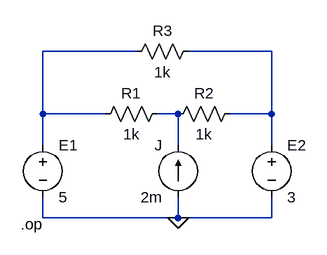
[diagram p0: schematic DC_superpozycja.asc]
DC_superpozycja.asc, the LTspice schematic file:
Version 4
SHEET 1 880 680
WIRE 128 16 -16 16
WIRE 336 16 208 16
WIRE -16 112 -16 16
WIRE 80 112 -16 112
WIRE 192 112 160 112
WIRE 336 112 336 16
WIRE 336 112 272 112
WIRE -16 160 -16 112
WIRE 192 160 192 112
WIRE 336 160 336 112
WIRE -16 272 -16 240
WIRE 192 272 192 240
WIRE 192 272 -16 272
WIRE 336 272 336 240
WIRE 336 272 192 272
FLAG 192 272 0
SYMBOL res 176 96 R90
WINDOW 0 0 56 VBottom 2
WINDOW 3 32 56 VTop 2
SYMATTR InstName R1
SYMATTR Value 1k
SYMBOL res 288 96 R90
WINDOW 0 0 56 VBottom 2
WINDOW 3 32 56 VTop 2
SYMATTR InstName R2
SYMATTR Value 1k
SYMBOL res 224 0 R90
WINDOW 0 0 56 VBottom 2
WINDOW 3 32 56 VTop 2
SYMATTR InstName R3
SYMATTR Value 1k
SYMBOL voltage -16 144 R0
WINDOW 123 0 0 Left 0
WINDOW 39 0 0 Left 0
SYMATTR InstName E1
SYMATTR Value 5
SYMBOL voltage 336 144 R0
WINDOW 123 0 0 Left 0
WINDOW 39 0 0 Left 0
SYMATTR InstName E2
SYMATTR Value 3
SYMBOL current 192 240 R180
WINDOW 0 24 80 Left 2
WINDOW 3 24 0 Left 2
WINDOW 123 0 0 Left 0
WINDOW 39 0 0 Left 0
SYMATTR InstName J
SYMATTR Value 2m
TEXT -50 282 Left 2 !.op

The netlist it stands for:
* DC_superpozycja.asc
R1 N003 N001 1k
R2 N002 N003 1k
R3 N002 N001 1k
V§E1 N001 0 5
V§E2 N002 0 3
I§J 0 N003 2m
.op
.backanno
.end